# Altium project Dimmer-Sub-Board-v2.0.PrjPcb
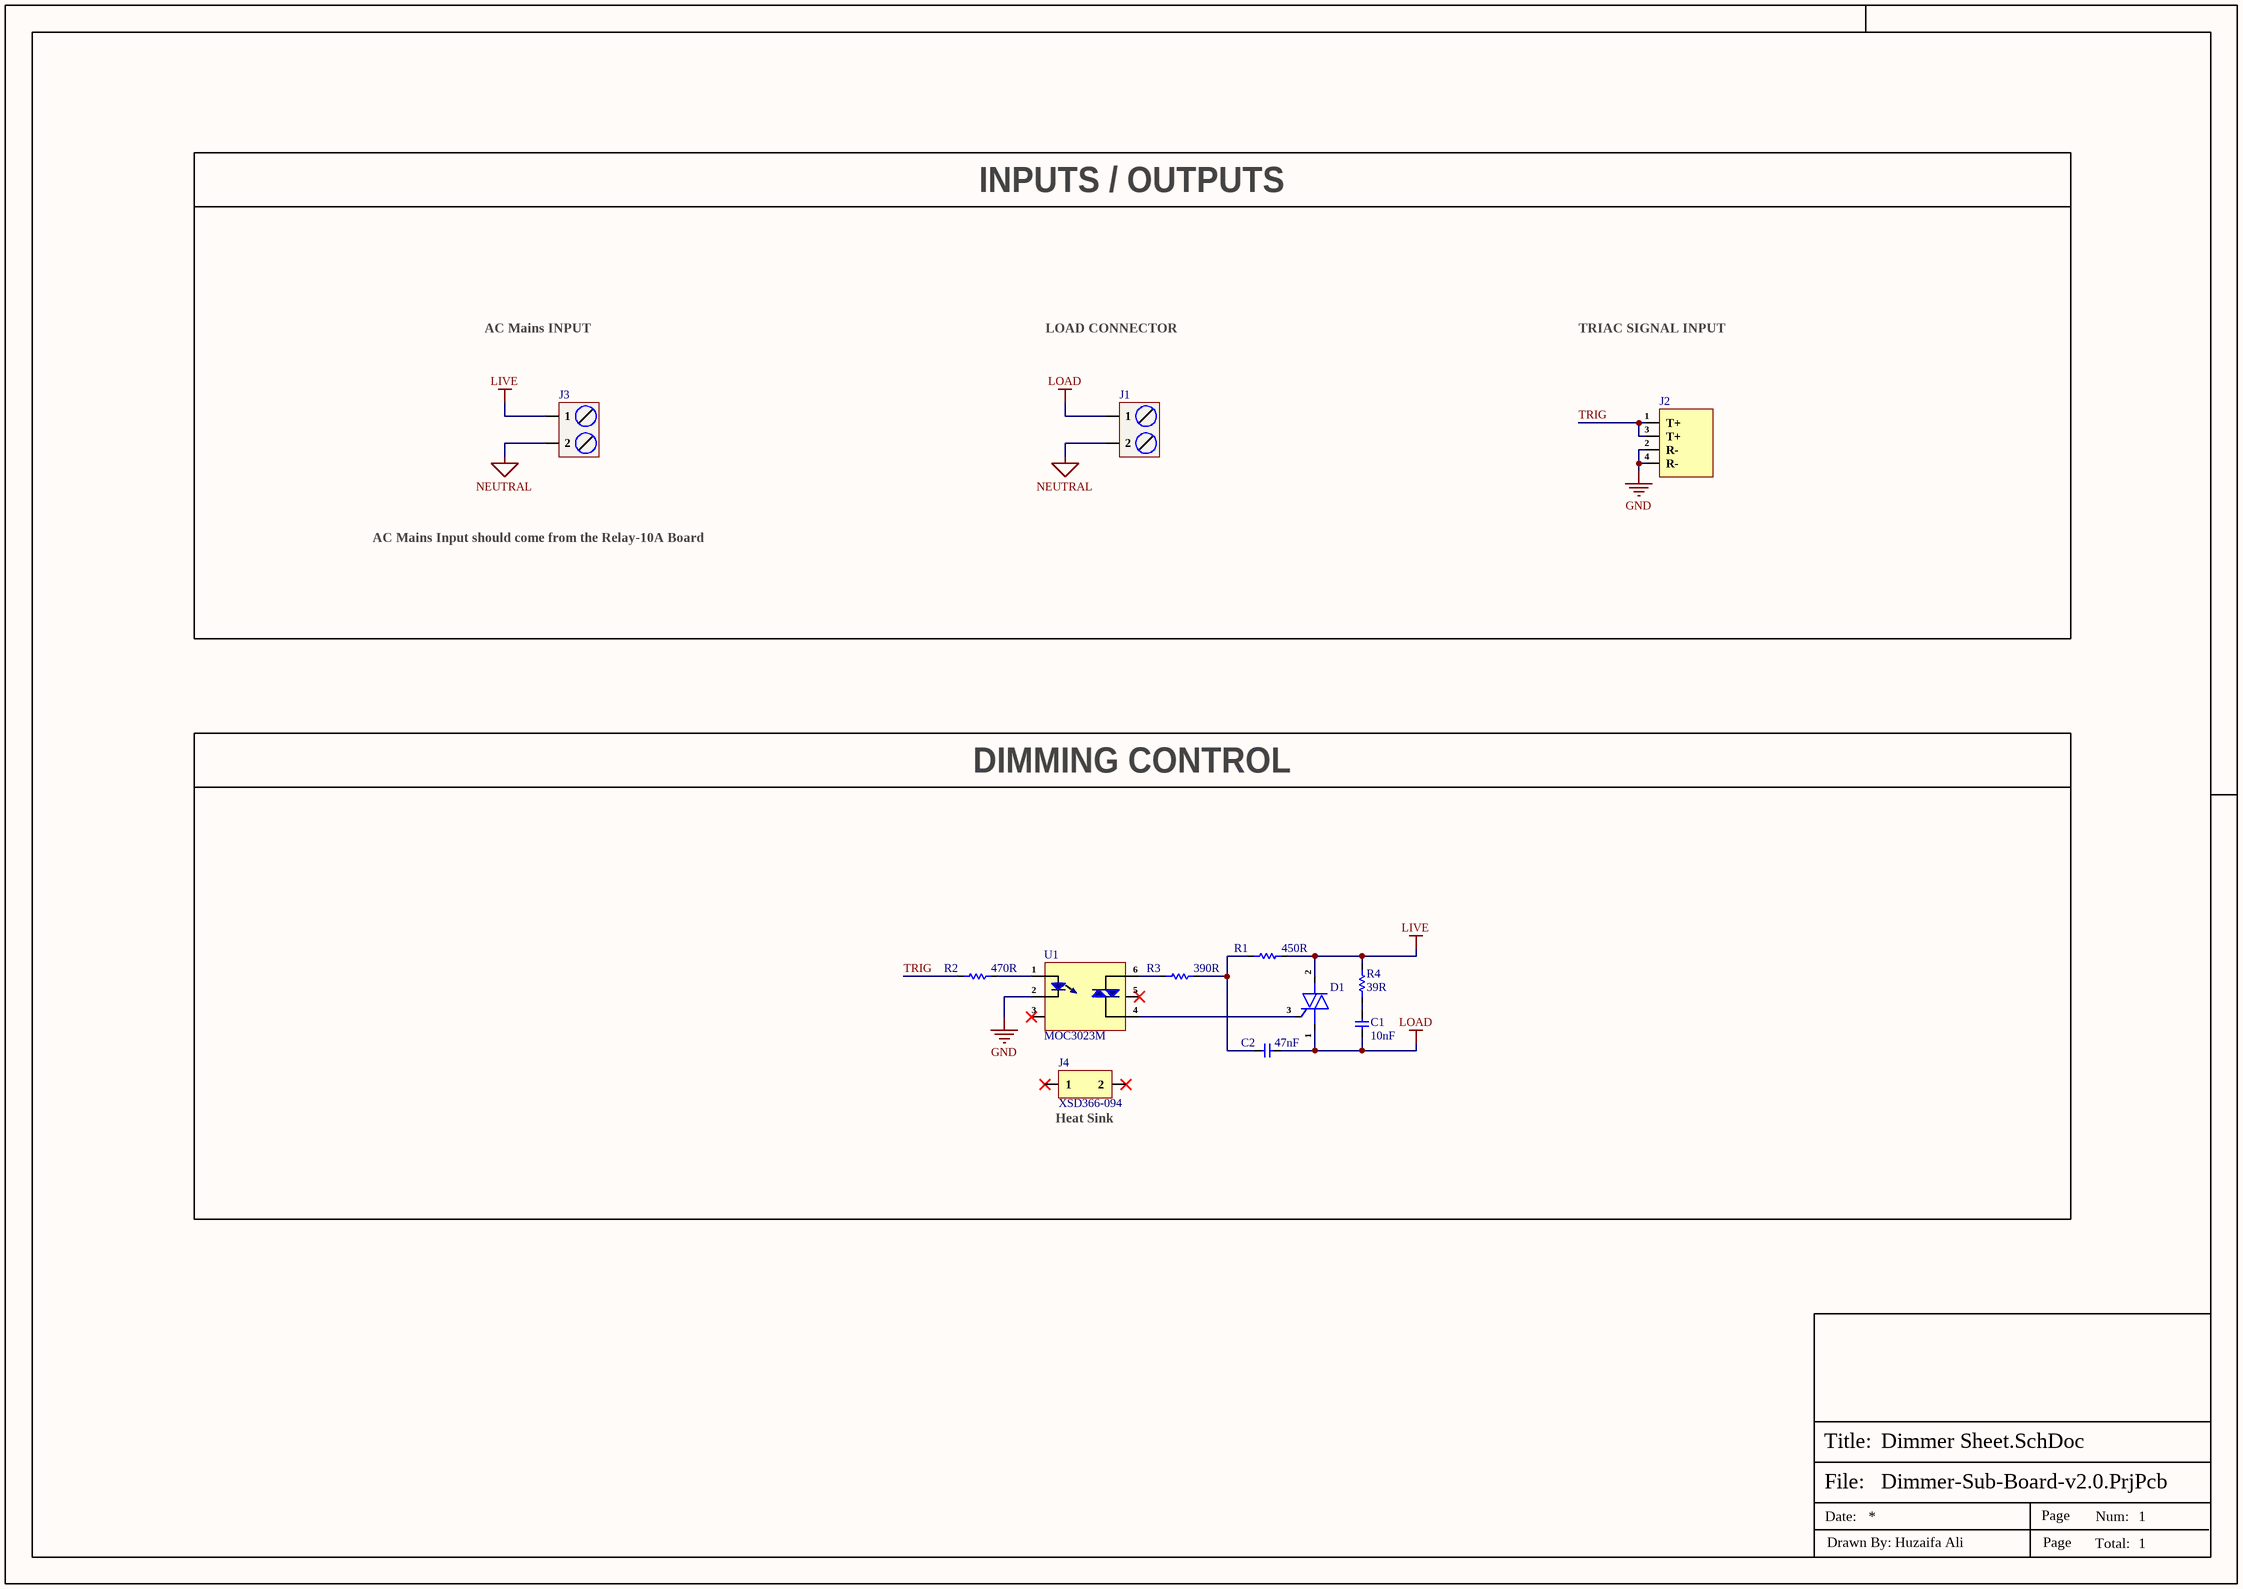
[diagram p0: Dimmer Sheet.SchDoc]
1 sheet, 12 parts. Net scope: global (net labels, ports and power ports of the same name join across sheets).
Board file: Dimmer-Sub-Board-v2.0.PcbDoc

## Sheet Dimmer Sheet.SchDoc
size 420 x 297 mm; SheetNumber: 1; SheetTotal: 1

### Parts
C1  10nF  [KP103J2G0501]
C2  47nF  [MMKP473J2J1001]
D1  BTA41-600BRG  [TOP3]  (value not drawn)
J1  DBT50G-7.62-2P-BK-P  [DBT50G-7.62-2P-BK-P]  (value not drawn)
J2  R-RJ11R04P-A802  [R-RJ11R04P-A802]  (value not drawn)
J3  DBT50G-7.62-2P-BK-P  [DBT50G-7.62-2P-BK-P]  (value not drawn)
J4  XSD366-094  [XSD366-094]
R1  450R  [EWWR0006J450RT9]
R2  470R  [Res-0603]
R3  390R  [EWWR0006J390RT9]
R4  39R  [MFR2WSJT-73-39R]
U1  MOC3023M  [6 Pin Dip]

### Blocks framed on the sheet
INPUTS / OUTPUTS: J1-J3
DIMMING CONTROL: C1 C2 D1 J4 R1-R4 U1

### Nets
GND: J2.2(R-) J2.4(R-) U1.2(Ca)
LIVE: D1.2(M2) J3.1 R1.2 R4.2
LOAD: C1.1 C2.2 D1.1(M1) J1.1
NEUTRAL: J1.2 J3.2
TRIG: J2.1(T+) J2.3(T+) R2.1
NetC1_2: C1.2 R4.1
NetC2_1: C2.1 R1.1 R3.2
NetD1_3: D1.3(G) U1.4(Terminal)
NetR2_2: R2.2 U1.1(An)
NetR3_1: R3.1 U1.6(Terminal)

Not connected (* = marked no-connect by the designer): J4 1* 2*; U1 3(NC)* 5(Substrate)*

### Notes on the sheet
- AC Mains INPUT
- LOAD CONNECTOR
- TRIAC SIGNAL INPUT
- AC Mains Input should come from the Relay-10A Board
- (near J4) Heat Sink
- File:
- Title:
- Date:
- Page
- Num:
- Total:
- Drawn By: Huzaifa Ali

### Library data of the parts
C1 = KP103J2G0501: 10nF -40℃~+100℃ ±5% 400V Plugin,P=5mm Polypropylene Film Capacitors (CBB) ROHS; Manufacturer: KYET; Manufacturer Part Number: KP103J2G0501; Package: Plugin,P=5mm; LCSC Part Number: C3019055; Item Type: Capacitor; ComponentLink1Description: LCSC; ComponentLink1URL: https://www.lcsc.com/product-detail/Polypropylene-Film-Capacitors-CBB_KYET-KP103J2G0501_C3019055.html
C2 = MMKP473J2J1001: 47nF -40℃~+105℃ ±5% 630V Plugin,P=10mm Polypropylene Film Capacitors (CBB) ROHS; Manufacturer: KYET; Supplier: LCSC; LCSC Part Number: C484939; Manufacturer Part Number: MMKP473J2J1001; Item Type: Capacitor; Stock: 4295; Pricing: 5=0.1166, 50=0.0957, 150=0.0852, 500=0.0684, 2500=0.0622, 5000=0.059 (USD); ComponentLink1Description: New link; ComponentLink1URL: https://www.lcsc.com/product-detail/Polypropylene-Film-Capacitors-CBB_KYET-MMKP473J2J1001_C484939.html
D1 = BTA41-600BRG: 80mA 50mA 600V TOP-3 Thyristors (SCR)/Modules ROHS; Manufacturer: STMicroelectronics; ComponentLink1Description: LCSC Link; ComponentLink1URL: https://www.lcsc.com/product-detail/Thyristors-SCR-Modules_STMicroelectronics-BTA41-600BRG_C9103.html; Manufacturer Part Number: BTA41-600BRG; LCSC Part Number: C9103; Item Type: Thyristors; Package: TOP-3
J1 J3 = DBT50G-7.62-2P-BK-P: 1x2P Corner With Cover Plate 2 1 7.62mm -40℃~+105℃ 20A 300V Black 12~22 Straight Needle Plugin,P=7.62mm Barrier Terminal Blocks ROHS; Manufacturer: DORABO; Manufacturer Part Number: DBT50G-7.62-2P-BK-P; Package: Plugin,P=7.62mm; LCSC Part Number: C496127; Item Type: Terminal Block; ComponentLink1Description: LCSC; ComponentLink1URL: https://www.lcsc.com/product-detail/Barrier-Terminal-Blocks_DORABO-DBT50G-7-62-2P-BK-P_C496127.html
J2 = R-RJ11R04P-A802: RJ11Receptacle 1 Plugin Ethernet Connectors / Modular Connectors (RJ45 RJ11) ROHS; Manufacturer: Ckmtw(Shenzhen Cankemeng); Manufacturer Part Number: R-RJ11R04P-A802; Package: Plugin; LCSC Part Number: C189737; Item Type: (RJ45 RJ11); ComponentLink1Description: LCSC; ComponentLink1URL: https://www.lcsc.com/product-detail/Ethernet-Connectors-Modular-Connectors-RJ45-RJ11_Ckmtw-Shenzhen-Cankemeng-R-RJ11R04P-A802_C189737.html
J4 = XSD366-094: 42*25*25MM Heat sink/heatsink; Manufacturer: XSD; Manufacturer Part Number: XSD366-094; Package: Custom; LCSC Part Number: C286227; Item Type: Heatsink; ComponentLink1Description: LCSC; ComponentLink1URL: https://www.lcsc.com/product-detail/Heat-sink-heatsink_XSD-XSD366-094_C286227.html
R1 = EWWR0006J450RT9: Wirewound Resistors 450Ω 6W ±250ppm/℃ ±5% Plugin,D8xL23.5mm Through Hole Resistors ROHS; Manufacturer: RESI; Manufacturer Part Number: EWWR0006J450RT9; Package: Plugin,D8xL23.5mm; LCSC Part Number: C348984; Item Type: Resistor; ComponentLink1Description: LCSC; ComponentLink1URL: https://www.lcsc.com/product-detail/Through-Hole-Resistors_RESI-EWWR0006J450RT9_C348984.html
R2 = RC0603FR-07470RL: RES 470 OHM 1% 1/10W 0603; Manufacturer: Yageo; Power Rating: 100mW; Voltage Rating: 50V; Temperature Coefficient: 100ppm/°C; Working Voltage: 75V; Supplier 1: Digi-Key; Manufacturer Part Number: RC0603FR-07470RL; RoHS: Yes; Category: Chip SMD Resistors; Stock 1: 154083; Pricing 1: 1=0.10000, 10=0.02400, 100=0.00970, 1000=0.00436, 2500=0.00378 (USD); Case/Package: 0603; Case Code (Metric): 1608; Case Code (Imperial): 0603; Min Operating Temperature: -55°C; Max Operating Temperature: 155°C; Tolerance: 1%; Resistance: 470R; Packaging: Tape and Reel; Package Quantity: 1; Resistor Type: Thick Film; Number of Terminations: 2; Termination: SMD/SMT; Max Power Dissipation: 100mW; Features: Moisture Resistant; Series: RC; Technology: THICK FILM; Resistance Tolerance: 1%; Construction: Rectangular; Length: 1.6mm; Width: 0.031inch; Height: 0.022inch; Depth: 0.8mm; RoHS Compliant: Yes; REACH SVHC: No SVHC; Military Standard: Not; Lead Free: Lead Free; ComponentLink1URL: https://datasheet.ciiva.com/11808/0900766b80f96399-11808177.pdf?src-supplier=RSComponents; ComponentLink1Description: https://datasheet.ciiva.com/11808/0900766b80f96399-11808177.pdf?src-supplier=RSComponents; ComponentLink2URL: https://datasheet.ciiva.com/7746/1738695-7746359.pdf?src-supplier=Element14; ComponentLink2Description: https://datasheet.ciiva.com/7746/1738695-7746359.pdf?src-supplier=Element14; ComponentLink3URL: https://datasheet.ciiva.com/7746/1738695-7746360.pdf?src-supplier=Element14; ComponentLink3Description: https://datasheet.ciiva.com/7746/1738695-7746360.pdf?src-supplier=Element14; ComponentLink4URL: https://datasheet.ciiva.com/7660/1868787-7660793.pdf?src-supplier=Element14; ComponentLink4Description: https://datasheet.ciiva.com/7660/1868787-7660793.pdf?src-supplier=Element14; ComponentLink5URL: https://datasheet.ciiva.com/46440/1868787-46440907.pdf?src-supplier=Element14; ComponentLink5Description: https://datasheet.ciiva.com/46440/1868787-46440907.pdf?src-supplier=Element14; ComponentLink6URL: https://datasheet.ciiva.com/2454/pyu-r-int-thick-7-2454012.pdf?src-supplier=Digi-Key; ComponentLink6Description: https://datasheet.ciiva.com/2454/pyu-r-int-thick-7-2454012.pdf?src-supplier=Digi-Key; ComponentLink7URL: https://datasheet.ciiva.com/2454/pyu-r-int-thick-7-2454013.pdf?src-supplier=Digi-Key; ComponentLink7Description: https://datasheet.ciiva.com/2454/pyu-r-int-thick-7-2454013.pdf?src-supplier=Digi-Key; ComponentLink8URL: https://datasheet.ciiva.com/2454/pyu-r-int-thick-7-2454014.pdf?src-supplier=Digi-Key; ComponentLink8Description: https://datasheet.ciiva.com/2454/pyu-r-int-thick-7-2454014.pdf?src-supplier=Digi-Key; Supplier Part Number 1: 311-470HRCT-ND; LCSC Part Number: C114669
R3 = EWWR0006J390RT9: Wirewound Resistors 390Ω 6W ±250ppm/℃ ±5% Plugin,D8xL23.5mm Through Hole Resistors ROHS; Manufacturer: RESI; Manufacturer Part Number: EWWR0006J390RT9; Package: Plugin,D8xL23.5mm; LCSC Part Number: C348979; Item Type: Resistor; ComponentLink1Description: LCSC; ComponentLink1URL: https://www.lcsc.com/product-detail/Through-Hole-Resistors_RESI-EWWR0006J390RT9_C348979.html
R4 = MFR2WSJT-73-39R: Metal Film Resistors 39Ω 2W ±5% Plugin,D4.5xL11.5mm Through Hole Resistors ROHS; Manufacturer: YAGEO; Manufacturer Part Number: MFR2WSJT-73-39R; Package: Plugin,D4.5xL11.5mm; LCSC Part Number: C176578; Item Type: Resistor; ComponentLink1Description: LCSC; ComponentLink1URL: https://www.lcsc.com/product-detail/Through-Hole-Resistors_YAGEO-MFR2WSJT-73-39R_C176578.html
U1 = MOC3023M: OPTOISOLATOR 4.17KV TRIAC 6DIP; Manufacturer: ON Semiconductor / Fairchild; Item Type: IC; Supplier: Future Electronics; LCSC Part Number: C5240; Manufacturer Part Number: MOC3023M; RoHS: Yes; Stock: 46500; Pricing: 1=0.215, 200=0.205, 750=0.196, 2500=0.19, 10000=0.176 (USD); ComponentLink1URL: https://datasheet.ciiva.com/15118/getdatasheetpartid-110426-15118245.pdf?src-supplier=Verical; ComponentLink1Description: https://datasheet.ciiva.com/15118/getdatasheetpartid-110426-15118245.pdf?src-supplier=Verical; ComponentLink2URL: https://datasheet.ciiva.com/8074/1806097-8074079.pdf?src-supplier=Element14; ComponentLink2Description: https://datasheet.ciiva.com/8074/1806097-8074079.pdf?src-supplier=Element14; ComponentLink3URL: https://datasheet.ciiva.com/8084/moc3023m-8084955.pdf?src-supplier=Avnet; ComponentLink3Description: https://datasheet.ciiva.com/8084/moc3023m-8084955.pdf?src-supplier=Avnet; ComponentLink4URL: https://datasheet.ciiva.com/2092/moc3010m-2092979.pdf?src-supplier=Digikey; ComponentLink4Description: https://datasheet.ciiva.com/2092/moc3010m-2092979.pdf?src-supplier=Digikey